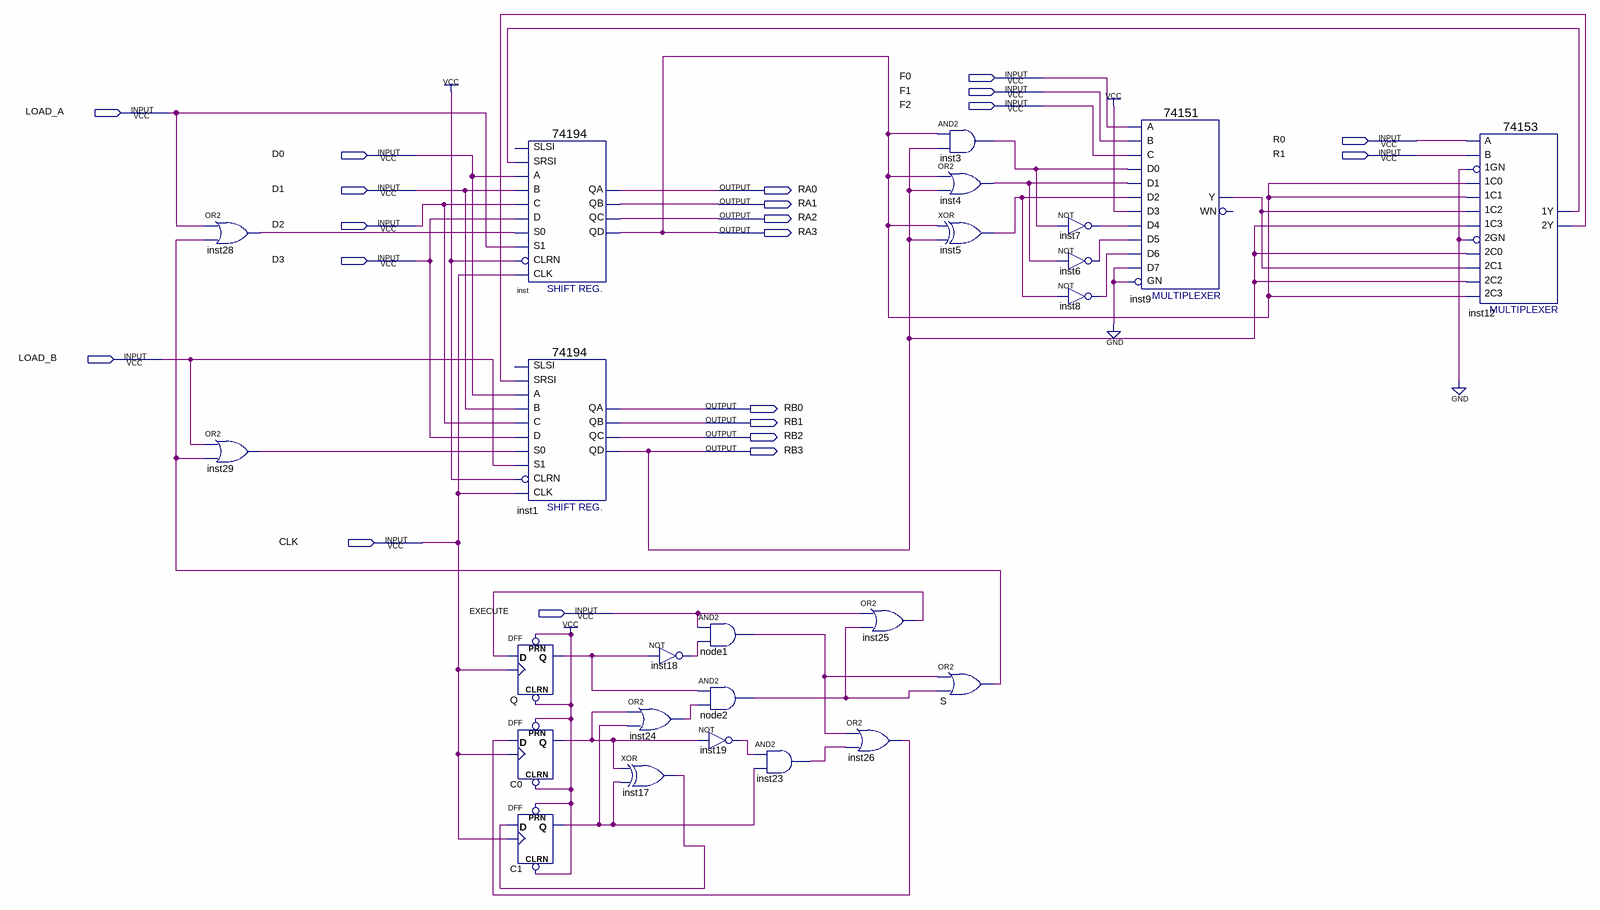
[diagram p0: schematic sheet]
// Quartus schematic lab3.bdf as structural Verilog: 25 symbols, 21 pins
module lab3 (
  input  F0,
  input  F1,
  input  F2,
  input  LOAD_A,
  input  R0,
  input  D0,
  input  R1,
  input  D1,
  input  D2,
  input  D3,
  input  LOAD_B,
  input  CLK,
  input  EXECUTE,
  output RA0,
  output RA1,
  output RA2,
  output RA3,
  output RB0,
  output RB1,
  output RB2,
  output RB3
);

  wire C0_q, C1_q, inst3_out, inst4_out, inst5_out, inst6_out, inst7_out, inst8_out, inst9_y, inst12_1y,
       inst12_2y, inst17_out, inst18_out, inst19_out, inst23_out, inst24_out, inst25_out, inst26_out,
       inst28_out, inst29_out, node1_out, node2_out, Q_q, S_out;

  or inst28 (inst28_out, LOAD_A, S_out);
  or inst29 (inst29_out, LOAD_B, S_out);
  \74194  inst (
    .SRSI(inst12_1y), .B(D1), .C(D2), .CLK(CLK), .CLRN(1'b1), .D(D3), .S1(LOAD_A), .S0(inst28_out), .A(D0),
    .QA(RA0), .QB(RA1), .QC(RA2), .QD(RA3));  // open: SLSI
  \74194  inst1 (
    .SRSI(inst12_2y), .B(D1), .C(D2), .CLK(CLK), .CLRN(1'b1), .D(D3), .S1(LOAD_B), .S0(inst29_out), .A(D0),
    .QA(RB0), .QB(RB1), .QC(RB2), .QD(RB3));  // open: SLSI
  DFF Q (.CLRN(1'b1), .CLK(CLK), .D(inst25_out), .PRN(1'b1), .Q(Q_q));
  DFF C0 (.CLRN(1'b1), .CLK(CLK), .D(inst26_out), .PRN(1'b1), .Q(C0_q));
  DFF C1 (.CLRN(1'b1), .CLK(CLK), .D(inst17_out), .PRN(1'b1), .Q(C1_q));
  or inst24 (inst24_out, C0_q, C1_q);
  xor inst17 (inst17_out, C0_q, C1_q);
  and node1 (node1_out, EXECUTE, inst18_out);
  not inst18 (inst18_out, Q_q);
  and node2 (node2_out, Q_q, inst24_out);
  not inst19 (inst19_out, C0_q);
  and inst23 (inst23_out, inst19_out, C1_q);
  or inst25 (inst25_out, EXECUTE, node2_out);
  or inst26 (inst26_out, node1_out, inst23_out);
  and inst3 (inst3_out, RA3, RB3);
  or inst4 (inst4_out, RA3, RB3);
  xor inst5 (inst5_out, RA3, RB3);
  or S (S_out, node1_out, node2_out);
  not inst7 (inst7_out, inst3_out);
  not inst6 (inst6_out, inst4_out);
  not inst8 (inst8_out, inst5_out);
  \74151  inst9 (
    .GN(1'b0), .C(F2), .B(F1), .A(F0), .D5(inst6_out), .D0(inst3_out), .D1(inst4_out), .D4(inst7_out),
    .D3(1'b1), .D2(inst5_out), .D6(inst8_out), .D7(1'b0), .Y(inst9_y));  // open: WN
  \74153  inst12 (
    .\1C1 (RA3), .\1GN (1'b0), .\1C0 (RA3), .\2C0 (RB3), .\2GN (1'b0), .\2C2 (RB3), .\1C2 (inst9_y),
    .\1C3 (RB3), .B(R1), .A(R0), .\2C1 (inst9_y), .\2C3 (RA3), .\1Y (inst12_1y), .\2Y (inst12_2y));
endmodule
